# EasyEDA Pro project C8T6v1.eprj, schematic Schematic3
Board Name: Board2; Create Date: 2026-07-29; Page Name: P1; Project Name: 12; Schematic Name: Schematic3; Update Date: 2026-07-29; Company: 嘉立创EDA; Page Size: A4; Version: V1.0
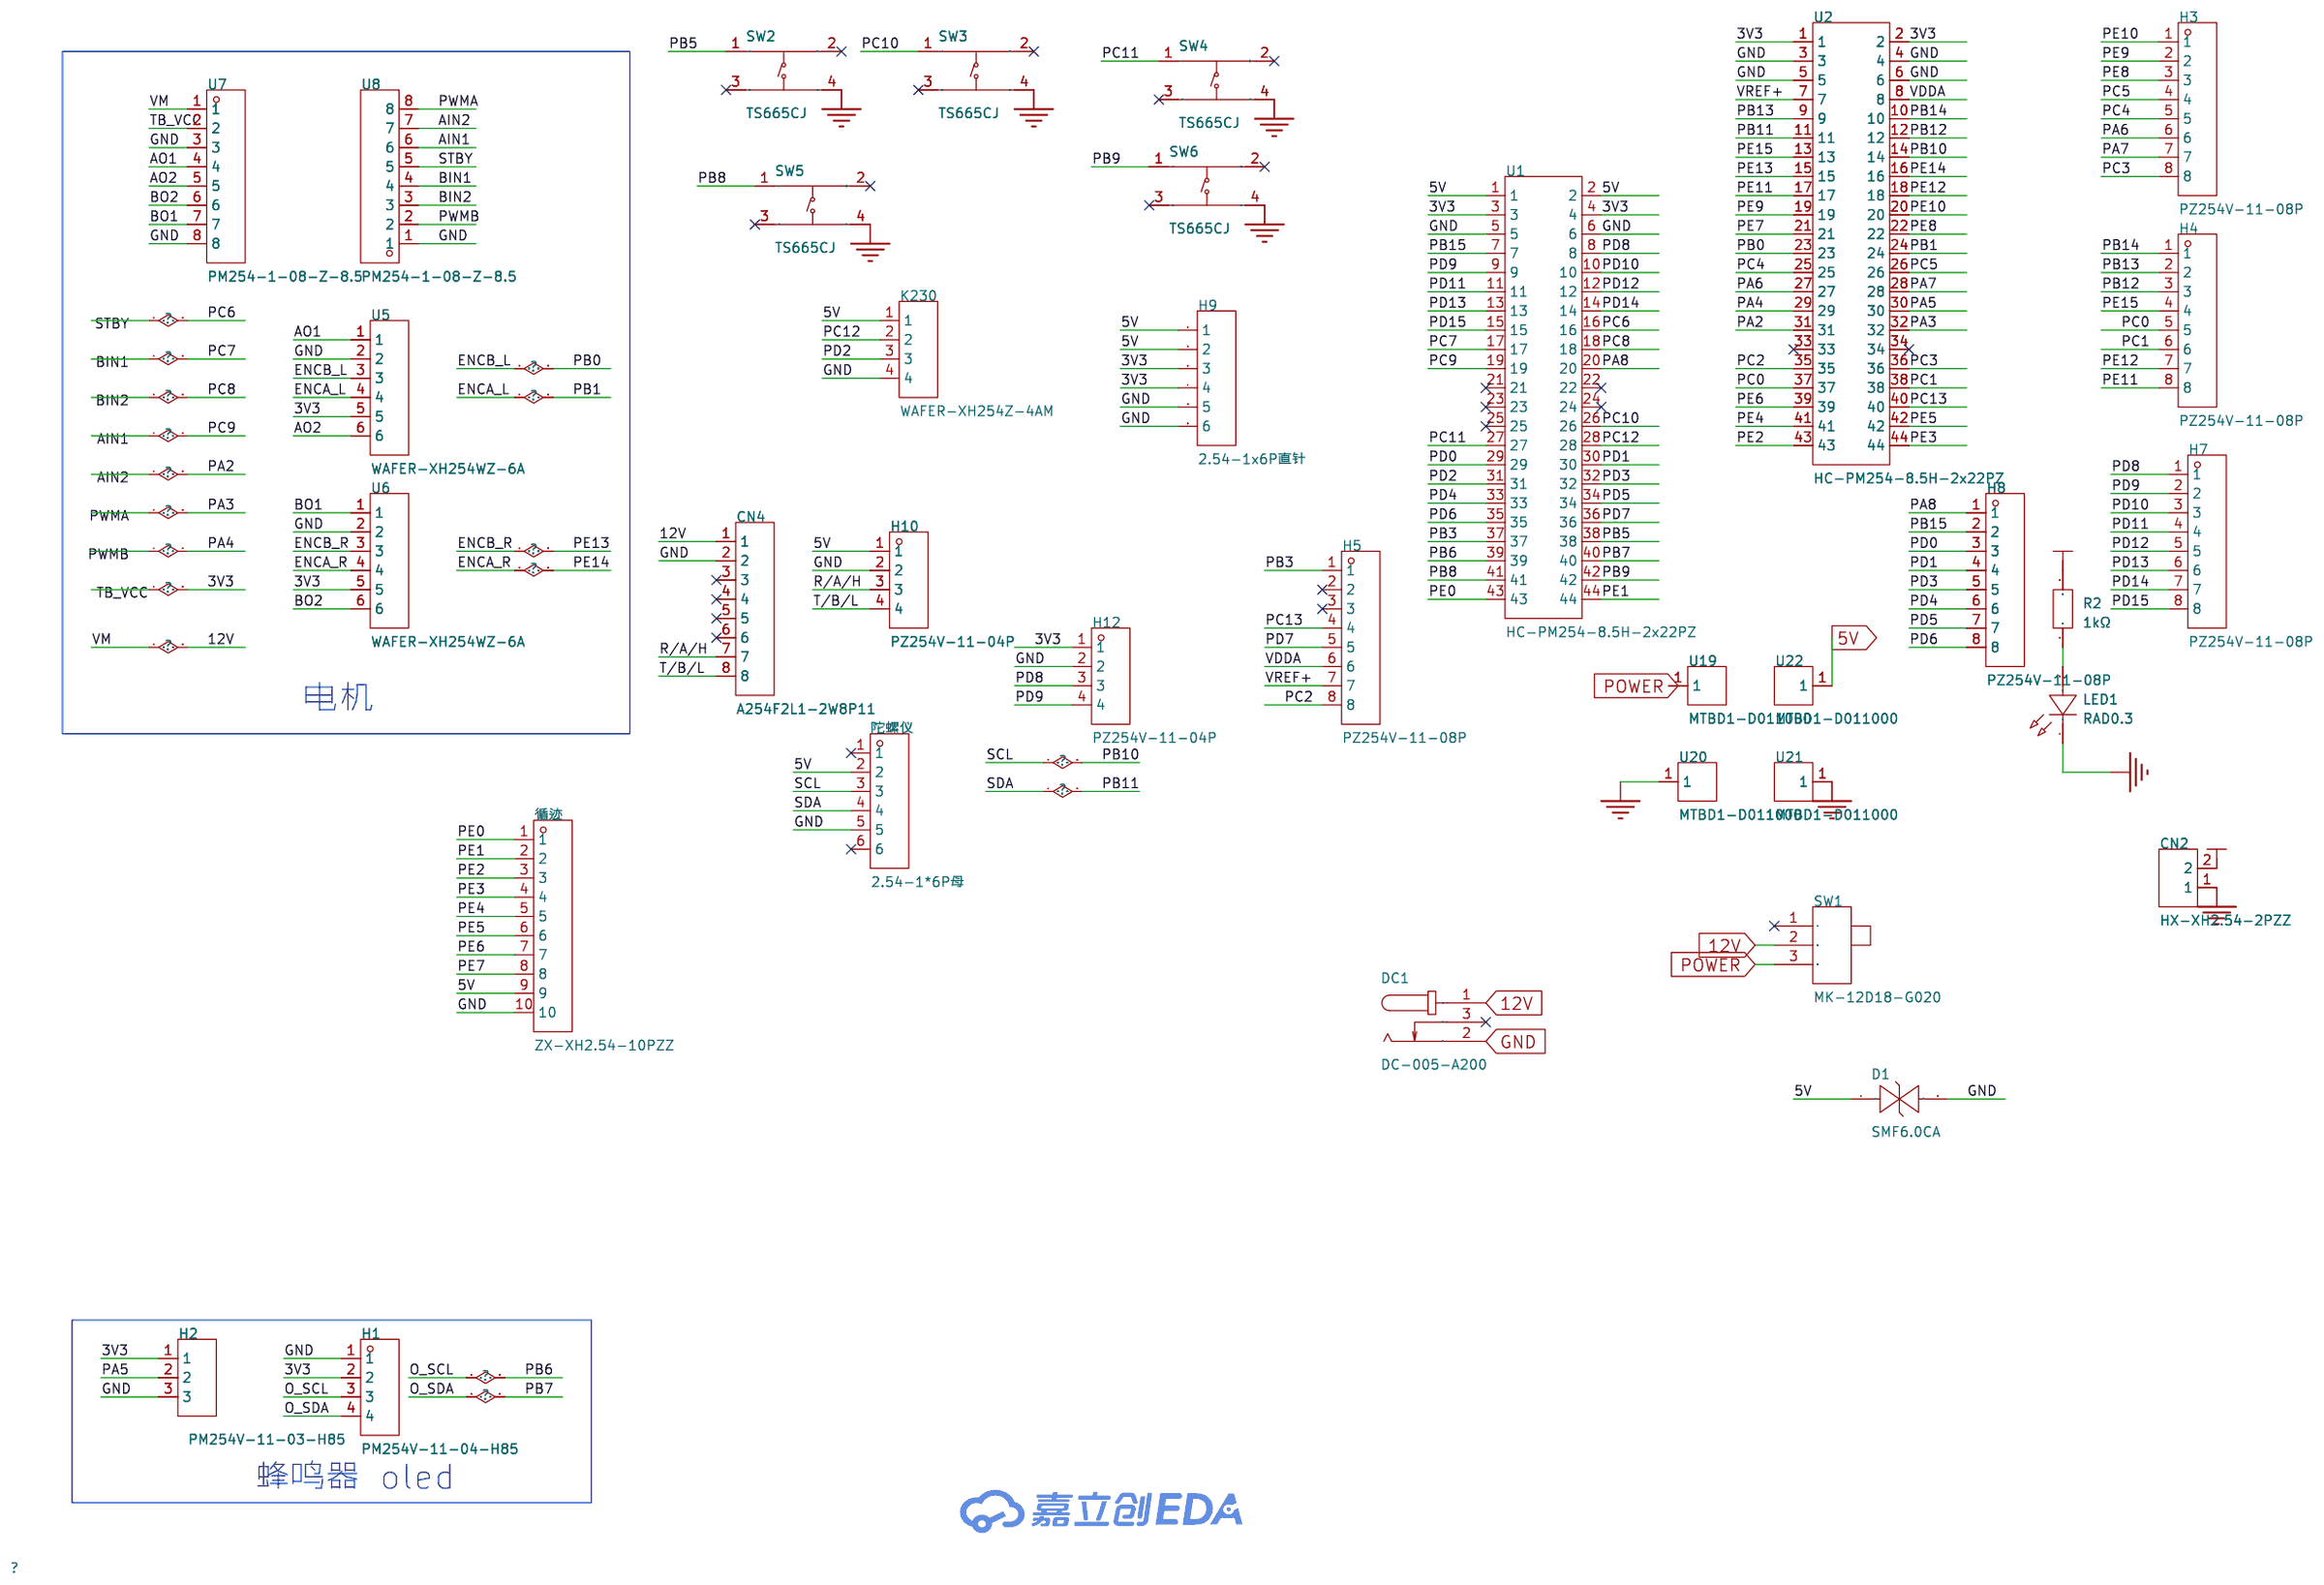
[diagram p2: schematic sheet]

## Parts
CN2  HX-XH2.54-2PZZ  [CONN-TH_2P-P2.50_HX-2.54MM-2P-ZZ-MS]
CN4  A254F2L1-2W8P11  [CONN-TH_8P-P2.54_A254F2L1-2W8P11]
D1  SMF6.0CA  [SOD-123FL_L2.7-W1.8-LS3.8-BI]
DC1  DC-005-A200  [DC-IN-TH_DC-005-A200]
H1  PM254V-11-04-H85  [HDR-TH_4P-P2.54-V-F]
H2  PM254V-11-03-H85  [HDR-TH_3P-P2.54-V-F]
H3  PZ254V-11-08P  [HDR-TH_8P-P2.54-V-M]
H4  PZ254V-11-08P  [HDR-TH_8P-P2.54-V-M]
H5  PZ254V-11-08P  [HDR-TH_8P-P2.54-V-M]
H7  PZ254V-11-08P  [HDR-TH_8P-P2.54-V-M]
H8  PZ254V-11-08P  [HDR-TH_8P-P2.54-V-M]
H9  2.54-1x6P直针  [HDR-TH_6P-P2.54-V-M-1]
H10  PZ254V-11-04P  [HDR-TH_4P-P2.54-V-M]
H12  PZ254V-11-04P  [HDR-TH_4P-P2.54-V-M]
K230  WAFER-XH254Z-4AM  [CONN-TH_WAFER-XH2.54-4PZZ-H62]
LED1  RAD0.3  [LED-TH_BD3.8-P2.54-RD]
R2  1kΩ  [RES-TH_BD2.7-L6.2-P10.20-D0.4]
SW1  MK-12D18-G020  [SW-TH_MK-12D18-G040]
SW2  TS665CJ  [SW-TH_4P-L6.0-W6.0-P4.50-LS6.5]
SW3  TS665CJ  [SW-TH_4P-L6.0-W6.0-P4.50-LS6.5]
SW4  TS665CJ  [SW-TH_4P-L6.0-W6.0-P4.50-LS6.5]
SW5  TS665CJ  [SW-TH_4P-L6.0-W6.0-P4.50-LS6.5]
SW6  TS665CJ  [SW-TH_4P-L6.0-W6.0-P4.50-LS6.5]
U1  HC-PM254-8.5H-2x22PZ  [HDR-TH_44P-P2.54-V-F-R2-C22-S2.54]
U2  HC-PM254-8.5H-2x22PZ  [HDR-TH_44P-P2.54-V-F-R2-C22-S2.54]
U5  WAFER-XH254WZ-6A  [CONN-TH_6P-P2.50_WAFER-XH254WZ-6A]
U6  WAFER-XH254WZ-6A  [CONN-TH_6P-P2.50_WAFER-XH254WZ-6A]
U7  PM254-1-08-Z-8.5  [HDR-TH_8P-P2.54-V-F]
U8  PM254-1-08-Z-8.5  [HDR-TH_8P-P2.54-V-F]
U19  MTBD1-D011000  [CONN-TH_MTBD1-D011000]
U20  MTBD1-D011000  [CONN-TH_MTBD1-D011000]
U21  MTBD1-D011000  [CONN-TH_MTBD1-D011000]
U22  MTBD1-D011000  [CONN-TH_MTBD1-D011000]
循迹  ZX-XH2.54-10PZZ  [CONN-TH_10P-P2.50_B10B-XH-A-LF-SN]
陀螺仪  2.54-1*6P母  [HDR-TH_6P-P2.54-V-F]

## Library data of the parts
CN2 = HX-XH2.54-2PZZ: LCSC Part Name: 1x2P 间距:2.54mm 直插 系列:XH; Supplier Part: C42391660; Manufacturer: hanxia(韩下); Supplier Footprint: 插件,P=2.5mm; JLCPCB Part Class: 扩展库; Datasheet: https://item.szlcsc.com/datasheet/HX-XH2.54-2PZZ/44326932.html; Supplier: LCSC; Pins Structure: 1x2P; Pitch: 2.54mm; Mounting Type: 直插; Reference Series: XH; Number of Pins: 2P; Number of Rows: 1; Number of PINs Per Row: 2; Current Rating: 3A; Contact Material: 黄铜; Contact Plating: 锡; Operating Temperature: -25℃~+85℃; Voltage Rating: 250V; Plastic Material: PA66; Flame Retardant Rating: UL94V-0; Color: 白色
CN4 = A254F2L1-2W8P11: LCSC Part Name: 插针结构：1x8P 间距：2.5mm 安装方式：直插 参考系列：XH; Supplier Part: C41409655; Manufacturer: JXTCONN(聚兴泰); Supplier Footprint: 插件,P=2.54mm; JLCPCB Part Class: 扩展库; Datasheet: https://item.szlcsc.com/datasheet/A254F2L1-2W8P11/43215792.html; Supplier: LCSC; Pins Structure: 1x8P; Pitch: 2.5mm; Mounting Type: 直插; Reference Series: XH; Number of Pins: 8P; Number of Rows: 1; Number of PINs Per Row: 8; Current Rating: 2A; Contact Material: 黄铜; Contact Plating: 锡; Operating Temperature: -25℃~+85℃; Voltage Rating: 250V; Plastic Material: PA66; Flame Retardant Rating: UL94V-0; Color: 白色; Z-Height of the Board: 7mm; X-Length of Bottom Edge on Board (Spacing Line): 22.5mm; Y-Width of Bottom Edge on Board: 5.9mm
D1 = SMF6.0CA_C19077500: LCSC Part Name: 双向TVS 6V截止 峰值浪涌电流：19.4A@10/1000us; Supplier Part: C19077500; Manufacturer: R+O(宏嘉诚); Supplier Footprint: SOD-123FL; JLCPCB Part Class: 扩展库; Datasheet: https://item.szlcsc.com/datasheet/SMF6.0CA/20275585.html; Supplier: LCSC; Polarity: 双向; Reverse Stand-Off Voltage (Vrwm): 6V; Clamping Voltage: 10.3V; Peak Pulse Current (Ipp): 19.4A@10/1000us; Peak Pulse Power Dissipation (Ppp): 200W@10/1000us; Voltage - Breakdown: 7.37V; Reverse Leakage Current (Ir): 400uA; Number of Channels: 单路; Operating Temperature: -55℃~+150℃; level of protection: IEC 61000-4-2; Type: TVS
DC1 = DC-005-A200: LCSC Part Name: DC电源插座 内径:2mm 外径:6.4mm; Supplier Part: C720557; Manufacturer: XUNPU(讯普); Supplier Footprint: 插件; JLCPCB Part Class: Extended Part; Datasheet: https://item.szlcsc.com/datasheet/DC-005-A200/763564.html; Supplier: LCSC; Connector Type: DC电源插座; Mounting Type: 弯插; Inside Contact Diameter: 2mm; Outside Contact Diameter: 6.4mm; Current Rating: 3A; Voltage Rating (Max): 30V; Operating Temperature: -20℃~+70℃
H1 = PM254V-11-04-H85: LCSC Part Name: 1x4P 间距:2.54mm 直插; Supplier Part: C541851; Manufacturer: XFCN(兴飞); Supplier Footprint: 插件,P=2.54mm; JLCPCB Part Class: 扩展库; Datasheet: https://item.szlcsc.com/datasheet/PM254V-11-04-H85/562472.html; Supplier: LCSC; Holes Structure: 1x4P; Pitch: 2.54mm; Circular Hole / Square Hole: 方孔; Mounting Type: 直插; Number of Rows: 单排; Number of Positions: 4P; Current Rating: 3A; Holes Direction: 顶部; Insulation Height: 8.5mm; Contact Material: 黄铜; Operating Temperature: -40℃~+105℃
H2 = PM254V-11-03-H85: LCSC Part Name: 1x3P 间距:2.54mm 直插; Supplier Part: C541850; Manufacturer: XFCN(兴飞); Supplier Footprint: 插件,P=2.54mm; JLCPCB Part Class: 扩展库; Datasheet: https://item.szlcsc.com/datasheet/PM254V-11-03-H85/562471.html; Supplier: LCSC; Holes Structure: 1x3P; Pitch: 2.54mm; Circular Hole / Square Hole: 方孔; Mounting Type: 直插; Number of Rows: 单排; Number of Positions: 3P; Current Rating: 3A; Holes Direction: 顶部; Insulation Height: 8.5mm; Contact Material: 黄铜; Operating Temperature: -40℃~+105℃
H3-H5 H7 H8 = PZ254V-11-08P: LCSC Part Name: 1x8P 间距:2.54mm 方针 直插; Supplier Part: C492407; Manufacturer: XFCN(兴飞); Supplier Footprint: 插件,P=2.54mm; JLCPCB Part Class: 扩展库; Datasheet: https://item.szlcsc.com/datasheet/PZ254V-11-08P/502963.html; Supplier: LCSC; Pin Structure: 1x8P; Pitch: 2.54mm; Circluar Pins/Square Pins: 方针; Mounting Type: 直插; Number of Rows: 单排; Number of Pins: 8P; Current Rating: 3A; Voltage Rating (Max): 250V; Length of Mating Pin: 6mm; Insulation Height: 2.5mm; Length of End Connection Pin: 3mm; Contact Material: 黄铜; Operating Temperature: -40℃~+105℃; Color: 黑色
H9 = 2.54-1x6P直针: LCSC Part Name: 1x6P 间距:2.54mm 方针 直插; Supplier Part: C37208; Manufacturer: BOOMELE(博穆精密); Supplier Footprint: 插件,P=2.54mm; JLCPCB Part Class: 扩展库; Datasheet: https://item.szlcsc.com/datasheet/2.54-1x6P%25E7%259B%25B4%25E9%2592%2588/38187.html; Supplier: LCSC; Pin Structure: 1x6P; Pitch: 2.54mm; Circluar Pins/Square Pins: 方针; Mounting Type: 直插; Number of Rows: 单排; Number of Pins: 6P; Current Rating: 3A; Length of Mating Pin: 6mm; Insulation Height: 2.5mm; Length of End Connection Pin: 3mm; Contact Material: 黄铜; Contact Plating: 金; Operating Temperature: -40℃~+105℃; Color: 黑色
H10 H12 = PZ254V-11-04P: LCSC Part Name: 1x4P 间距:2.54mm 方针 直插; Supplier Part: C2691448; Manufacturer: XFCN(兴飞); Supplier Footprint: 插件,P=2.54mm; JLCPCB Part Class: 扩展库; Datasheet: https://item.szlcsc.com/datasheet/PZ254V-11-04P/2801085.html; Supplier: LCSC; Pin Structure: 1x4P; Pitch: 2.54mm; Circluar Pins/Square Pins: 方针; Mounting Type: 直插; Number of Rows: 单排; Number of Pins: 4P; Current Rating: 3A; Voltage Rating (Max): 250V; Length of Mating Pin: 6mm; Insulation Height: 2.5mm; Length of End Connection Pin: 3mm; Operating Temperature: -40℃~+105℃; Color: 黑色
K230 = WAFER-XH254Z-4AM: LCSC Part Name: 1x4P 间距:2.54mm 直插 系列:XH; Supplier Part: C22751824; Manufacturer: HANBO(汉博); Supplier Footprint: 插件,P=2.54mm; JLCPCB Part Class: 扩展库; Datasheet: https://item.szlcsc.com/datasheet/WAFER-XH254Z-4AM/24478759.html; Supplier: LCSC; Pins Structure: 1x4P; Pitch: 2.54mm; Mounting Type: 直插; Reference Series: XH; Number of Pins: 4P; Number of Rows: 1; Number of PINs Per Row: 4; Current Rating: 3A; Contact Material: 黄铜; Operating Temperature: -25℃~+85℃; Voltage Rating: 250V; Plastic Material: PA66; Flame Retardant Rating: UL94V-0
LED1 = RAD0.3: Supplier Part: C9900004941; Supplier Footprint: LED-TH_BD3.8-P2.54; JLCPCB Part Class: Extended Part; Supplier: LCSC
R2 = MF1/4W-1K±1%-ST52: LCSC Part Name: 金属膜电阻 1kΩ ±1% 250mW; Supplier Part: C2903245; Manufacturer: VO(翔胜); Supplier Footprint: 插件,D2.7xL6.2mm; JLCPCB Part Class: 扩展库; Datasheet: https://item.szlcsc.com/datasheet/MF1%252F4W-1K%25C2%25B11%2525-ST52/3158996.html; Supplier: LCSC; Type: 金属膜电阻; Tolerance: ±1%; Voltage-Supply(Max): 250V; Power(Watts): 250mW; Temperature Coefficient: ±100ppm/℃; Operating Temperature: -55℃~+155℃
SW1 = MK-12D18-G020: LCSC Part Name: 边三脚微型拨动开关G4; Supplier Part: C3019727; Manufacturer: G-Switch(品赞); Supplier Footprint: 弯插,8.6x3.5mm; JLCPCB Part Class: 扩展库; Datasheet: https://item.szlcsc.com/datasheet/MK-12D18-G020/3538033.html; Supplier: LCSC; Circuit: 单刀双掷; Actuator Style: 矩形柱状; Termination Style: PC引脚; Length: 8.55mm; Width: 3.5mm; Switch Height: 5.5mm; Mounting Type: 弯插; Actuator Color: 黑色; Current Rating: 500mA; Voltage Rating: 12V; Life: 1万次; Operating Temperature: -20℃~+70℃
SW2-SW6 = TS665CJ: LCSC Part Name: 6*6*5mm 直插 轻触开关; Supplier Part: C393938; Manufacturer: SHOU HAN(首韩); Supplier Footprint: 插件-4P,6x6mm; JLCPCB Part Class: 扩展库; Datasheet: https://item.szlcsc.com/datasheet/TS665CJ/372550.html; Supplier: LCSC; Circuit: 单刀单掷; Actuator Style: 圆形按钮; Operating Force: 2.5N; Mounting Type: 直插; Length: 6mm; Width: 6mm; Switch Height: 5mm; with Bracket: 不带支架; Contact Current: 50mA; Voltage Rating: 12V; Actuator/Cap Color: 黑色; With Lamp: 无; Termination Style: PC引脚; Life: 5万次; Operating Temperature: -25℃~+70℃
U1 U2 = HC-PM254-8.5H-2x22PZ: LCSC Part Name: 间距2.54mm 2x22Pin 直插 PC3.0 H8.5; Supplier Part: C27985237; Manufacturer: HC(虹成电子); Supplier Footprint: 插件,P=2.54mm; JLCPCB Part Class: 扩展库; Datasheet: https://item.szlcsc.com/datasheet/HC-PM254-8.5H-2x22PZ/29721195.html; Supplier: LCSC; Holes Structure: 2x22P; Pitch: 2.54mm; Row Spacing: 2.54mm; Circular Hole / Square Hole: 方孔; Mounting Type: 直插; Number of Rows: 双排; Number of Positions: 44P; Current Rating: 3A; Holes Direction: 顶部; Insulation Height: 8.5mm; Contact Material: 黄铜; Contact Plating: 金; Operating Temperature: -40℃~+105℃; PIN Length: 3mm
U5 U6 = WAFER-XH254WZ-6A: LCSC Part Name: 1x6P 间距:2.54mm 弯插 系列:XH; Supplier Part: C7432695; Manufacturer: HANBO(汉博); Supplier Footprint: 插件,P=2.5mm; JLCPCB Part Class: 扩展库; Datasheet: https://item.szlcsc.com/datasheet/WAFER-XH254WZ-6A/8437692.html; Supplier: LCSC; Pins Structure: 1x6P; Pitch: 2.54mm; Mounting Type: 弯插; Reference Series: XH; Number of Pins: 6P; Number of Rows: 1; Number of PINs Per Row: 6; Current Rating: 3A; Contact Material: 黄铜; Operating Temperature: -25℃~+85℃; Voltage Rating: 250V; Plastic Material: PA66; Flame Retardant Rating: UL94V-0
U7 U8 = PM254-1-08-Z-8.5: LCSC Part Name: 1x8P 间距:2.54mm 直插; Supplier Part: C2897371; Manufacturer: HCTL(华灿天禄); Supplier Footprint: 插件,P=2.54mm; JLCPCB Part Class: 扩展库; Datasheet: https://item.szlcsc.com/datasheet/PM254-1-08-Z-8.5/3142376.html; Supplier: LCSC; Holes Structure: 1x8P; Pitch: 2.54mm; Circular Hole / Square Hole: 方孔; Mounting Type: 直插; Number of Rows: 单排; Number of Positions: 8P; Current Rating: 3A; Holes Direction: 顶部; Insulation Height: 8.5mm; Contact Material: 铜合金; Operating Temperature: -40℃~+105℃
U19-U22 = MTBD1-D011000: LCSC Part Name: 1x1P 间距:2.54mm 直插; Supplier Part: C48983276; Manufacturer: MINTRON(明硕); Supplier Footprint: 插件,P=2.54mm; JLCPCB Part Class: 扩展库; Datasheet: https://item.szlcsc.com/datasheet/MTBD1-D011000/51316311.html; Supplier: LCSC; Holes Structure: 1x1P; Pitch: 2.54mm; Circular Hole / Square Hole: 圆孔; Mounting Type: 直插; Number of Rows: 单排; Number of Positions: 1P; Current Rating: 3A; Holes Direction: 顶部; Insulation Height: 7mm; Operating Temperature: -40℃~+105℃
循迹 = ZX-XH2.54-10PZZ: LCSC Part Name: 1x10P 间距:2.5mm 直插 系列:XH; Supplier Part: C7429640; Manufacturer: Megastar(兆星); Supplier Footprint: 插件,P=2.5mm; JLCPCB Part Class: 扩展库; Datasheet: https://item.szlcsc.com/datasheet/ZX-XH2.54-10PZZ/8427557.html; Supplier: LCSC; Pins Structure: 1x10P; Pitch: 2.5mm; Mounting Type: 直插; Reference Series: XH; Number of Pins: 10P; Number of Rows: 1; Number of PINs Per Row: 10; Current Rating: 3A; Contact Material: 黄铜; Contact Plating: 锡; Operating Temperature: -25℃~+85℃; Voltage Rating: 250V; Plastic Material: PA66; Flame Retardant Rating: UL94V-0; Color: 白色; Z-Height of the Board: 7mm; X-Length of Bottom Edge on Board (Spacing Line): 27.5mm; Y-Width of Bottom Edge on Board: 5.9mm
陀螺仪 = 2.54-1*6P母: LCSC Part Name: 1x6P 间距:2.54mm 直插; Supplier Part: C40877; Manufacturer: BOOMELE(博穆精密); Supplier Footprint: 插件,P=2.54mm; JLCPCB Part Class: 扩展库; Datasheet: https://item.szlcsc.com/datasheet/2.54-1*6P%25E6%25AF%258D/41861.html; Supplier: LCSC; Holes Structure: 1x6P; Pitch: 2.54mm; Circular Hole / Square Hole: 方孔; Mounting Type: 直插; Number of Rows: 单排; Number of Positions: 6P; Current Rating: 3A; Holes Direction: 顶部; Contact Material: 黄铜; Operating Temperature: -40℃~+105℃; PIN Length: 3.3mm

## Nets
3V3: H1.2 H2.1 H9.3 H9.4 H12.1 U1.3 U1.4 U2.1 U2.2 U5.5 U6.5 U7.2
5V: CN2.2 D1.1 H9.1 H9.2 H10.1 K230.1 R2.2 U1.1 U1.2 U22.1 循迹.9 陀螺仪.2
12V: CN4.1 DC1.1 SW1.2 U7.1
GND: CN2.1 CN4.2 D1.2 DC1.2 H1.1 H2.3 H9.5 H9.6 H10.2 H12.2 K230.4 LED1.1(K) SW2.4(D) SW3.4(D) SW4.4(D) SW5.4(D) SW6.4(D) U1.5 U1.6 U2.3 U2.4 U2.5 U2.6 U5.2 U6.2 U7.3 U7.8 U8.1 U20.1 U21.1 循迹.10 陀螺仪.5
VDDA: H5.6 U2.8
AIN1: U1.19 U8.6
AIN2: U2.31 U8.7
AO1: U5.1 U7.4
AO2: U5.6 U7.5
BIN1: U1.17 U8.4
BIN2: U1.18 U8.3
BO1: U6.1 U7.7
BO2: U6.6 U7.6
ENCA_L: U2.24 U5.4
ENCA_R: U2.16 U6.4
ENCB_L: U2.23 U5.3
ENCB_R: U2.15 U6.3
O_SCL: H1.3 U1.39
O_SDA: H1.4 U1.40
PA3: U2.32 U8.8
PA4: U2.29 U8.2
PA5: H2.2 U2.30
PA6: H3.6 U2.27
PA7: H3.7 U2.28
PA8: H8.1 U1.20
PB3: H5.1 U1.37
PB5: SW2.1(A) U1.38
PB8: SW5.1(A) U1.41
PB9: SW6.1(A) U1.42
PB10: U2.14 陀螺仪.3
PB11: U2.11 陀螺仪.4
PB12: H4.3 U2.12
PB13: H4.2 U2.9
PB14: H4.1 U2.10
PB15: H8.2 U1.7
PC0: H4.5 U2.37
PC1: H4.6 U2.38
PC2: H5.8 U2.35
PC3: H3.8 U2.36
PC4: H3.5 U2.25
PC5: H3.4 U2.26
PC6: U1.16 U8.5
PC10: SW3.1(A) U1.26
PC11: SW4.1(A) U1.27
PC12: K230.2 U1.28
PC13: H5.4 U2.40
PD0: H8.3 U1.29
PD1: H8.4 U1.30
PD2: K230.3 U1.31
PD3: H8.5 U1.32
PD4: H8.6 U1.33
PD5: H8.7 U1.34
PD6: H8.8 U1.35
PD7: H5.5 U1.36
PD8: H7.1 H12.3 U1.8
PD9: H7.2 H12.4 U1.9
PD10: H7.3 U1.10
PD11: H7.4 U1.11
PD12: H7.5 U1.12
PD13: H7.6 U1.13
PD14: H7.7 U1.14
PD15: H7.8 U1.15
PE0: U1.43 循迹.1
PE1: U1.44 循迹.2
PE2: U2.43 循迹.3
PE3: U2.44 循迹.4
PE4: U2.41 循迹.5
PE5: U2.42 循迹.6
PE6: U2.39 循迹.7
PE7: U2.21 循迹.8
PE8: H3.3 U2.22
PE9: H3.2 U2.19
PE10: H3.1 U2.20
PE11: H4.8 U2.17
PE12: H4.7 U2.18
PE15: H4.4 U2.13
POWER: SW1.3 U19.1
R/A/H: CN4.7 H10.3
T/B/L: CN4.8 H10.4
VREF+: H5.7 U2.7
$1N1923: LED1.2(A) R2.1

Not connected (* = marked no-connect by the designer): CN4 3* 4* 5* 6*; DC1 3*; H5 2* 3*; SW1 1*; SW2 2(B)* 3(C)*; SW3 2(B)* 3(C)*; SW4 2(B)* 3(C)*; SW5 2(B)* 3(C)*; SW6 2(B)* 3(C)*; U1 21* 22* 23* 24* 25*; U2 33* 34*; 陀螺仪 1* 6*

## Notes on the sheet
- 电机
- 蜂鸣器 oled
